# Altium project AVault.PrjPcb (part 2 of 2)

## Sheet Lighting.SchDoc
size A; SheetNumber: 5; SheetTotal: 5
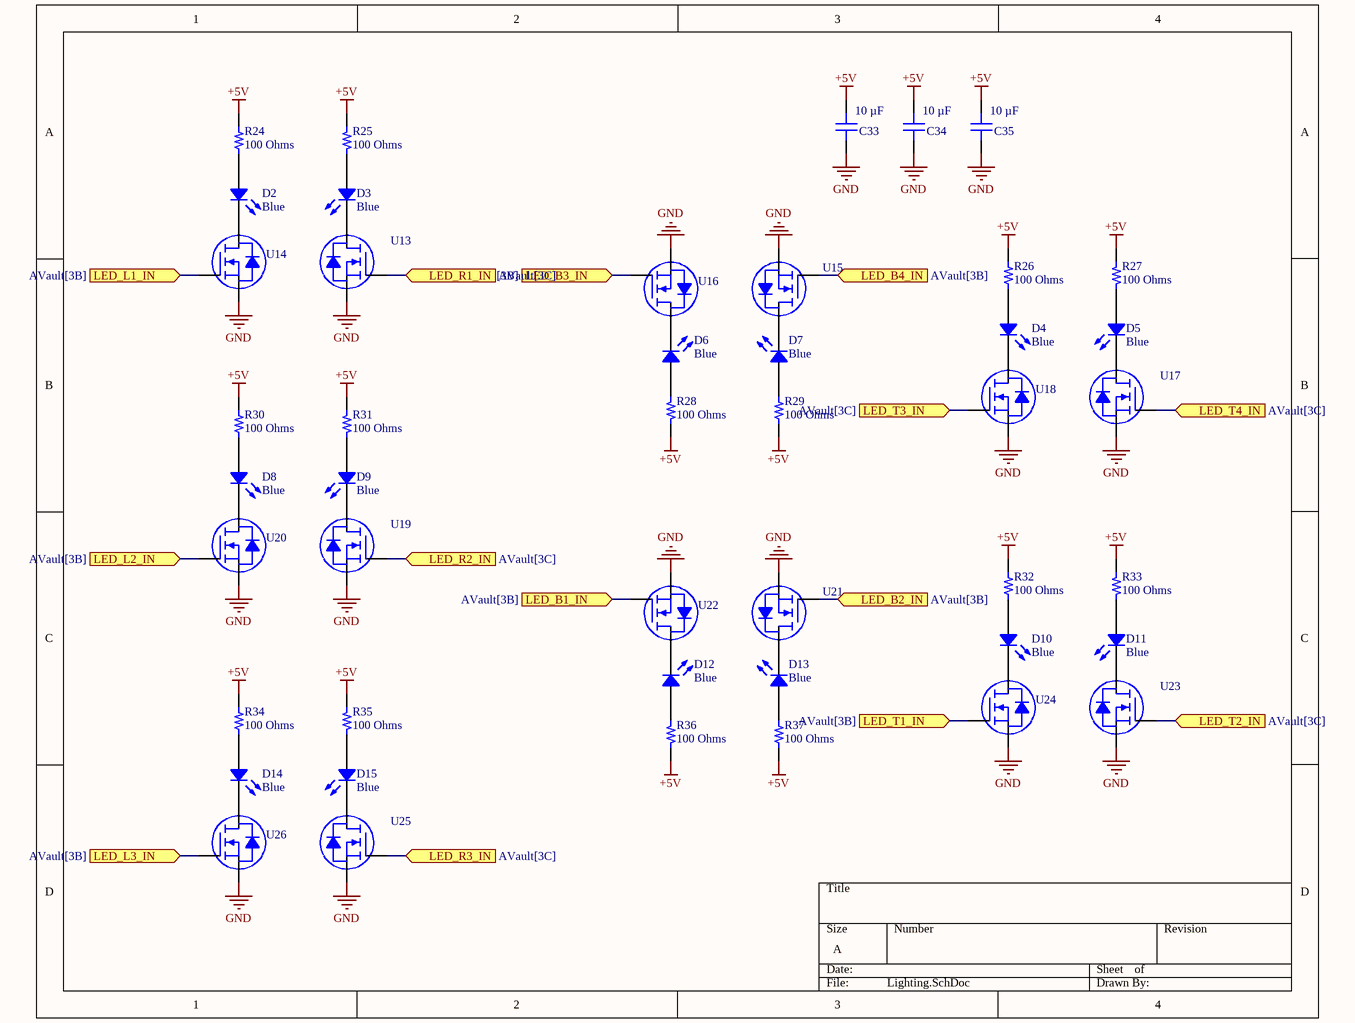
[diagram p4: Lighting.SchDoc]

### Parts
C33  10 µF  [CAP 0805_2012]
C34  10 µF  [CAP 0805_2012]
C35  10 µF  [CAP 0805_2012]
D2  Blue  [LED 0805_2012 BLUE]
D3  Blue  [LED 0805_2012 BLUE]
D4  Blue  [LED 0805_2012 BLUE]
D5  Blue  [LED 0805_2012 BLUE]
D6  Blue  [LED 0805_2012 BLUE]
D7  Blue  [LED 0805_2012 BLUE]
D8  Blue  [LED 0805_2012 BLUE]
D9  Blue  [LED 0805_2012 BLUE]
D10  Blue  [LED 0805_2012 BLUE]
D11  Blue  [LED 0805_2012 BLUE]
D12  Blue  [LED 0805_2012 BLUE]
D13  Blue  [LED 0805_2012 BLUE]
D14  Blue  [LED 0805_2012 BLUE]
D15  Blue  [LED 0805_2012 BLUE]
R24  100 Ohms  [RES 0805_2012]
R25  100 Ohms  [RES 0805_2012]
R26  100 Ohms  [RES 0805_2012]
R27  100 Ohms  [RES 0805_2012]
R28  100 Ohms  [RES 0805_2012]
R29  100 Ohms  [RES 0805_2012]
R30  100 Ohms  [RES 0805_2012]
R31  100 Ohms  [RES 0805_2012]
R32  100 Ohms  [RES 0805_2012]
R33  100 Ohms  [RES 0805_2012]
R34  100 Ohms  [RES 0805_2012]
R35  100 Ohms  [RES 0805_2012]
R36  100 Ohms  [RES 0805_2012]
R37  100 Ohms  [RES 0805_2012]
U13  2N7002A-7  [DIODES SOT-23-3]  (value not drawn)
U14  2N7002A-7  [DIODES SOT-23-3]  (value not drawn)
U15  2N7002A-7  [DIODES SOT-23-3]  (value not drawn)
U16  2N7002A-7  [DIODES SOT-23-3]  (value not drawn)
U17  2N7002A-7  [DIODES SOT-23-3]  (value not drawn)
U18  2N7002A-7  [DIODES SOT-23-3]  (value not drawn)
U19  2N7002A-7  [DIODES SOT-23-3]  (value not drawn)
U20  2N7002A-7  [DIODES SOT-23-3]  (value not drawn)
U21  2N7002A-7  [DIODES SOT-23-3]  (value not drawn)
U22  2N7002A-7  [DIODES SOT-23-3]  (value not drawn)
U23  2N7002A-7  [DIODES SOT-23-3]  (value not drawn)
U24  2N7002A-7  [DIODES SOT-23-3]  (value not drawn)
U25  2N7002A-7  [DIODES SOT-23-3]  (value not drawn)
U26  2N7002A-7  [DIODES SOT-23-3]  (value not drawn)

### Ports
LED_B1_IN (in, see AVault[3B]), LED_B2_IN (in, see AVault[3B]), LED_B3_IN (in, see AVault[3B]), LED_B4_IN (in, see AVault[3B]), LED_L1_IN (in, see AVault[3B]), LED_L2_IN (in, see AVault[3B]), LED_L3_IN (in, see AVault[3B]), LED_R1_IN (in, see AVault[3C]), LED_R2_IN (in, see AVault[3C]), LED_R3_IN (in, see AVault[3C]), LED_T1_IN (in, see AVault[3B]), LED_T2_IN (in, see AVault[3C]), LED_T3_IN (in, see AVault[3C]), LED_T4_IN (in, see AVault[3C])

### Nets
+5V: C33.2 C34.2 C35.2 R24.2 R25.2 R26.2 R27.2 R28.2 R29.2 R30.2 R31.2 R32.2 R33.2 R34.2 R35.2 R36.2 R37.2
GND: C33.1 C34.1 C35.1 U13.2(S) U14.2(S) U15.2(S) U16.2(S) U17.2(S) U18.2(S) U19.2(S) U20.2(S) U21.2(S) U22.2(S) U23.2(S) U24.2(S) U25.2(S) U26.2(S)
NetD2_1: D2.1 R24.1
NetD2_2: D2.2 U14.3(D)
NetD3_1: D3.1 R25.1
NetD3_2: D3.2 U13.3(D)
NetD4_1: D4.1 R26.1
NetD4_2: D4.2 U18.3(D)
NetD5_1: D5.1 R27.1
NetD5_2: D5.2 U17.3(D)
NetD6_1: D6.1 R28.1
NetD6_2: D6.2 U16.3(D)
NetD7_1: D7.1 R29.1
NetD7_2: D7.2 U15.3(D)
NetD8_1: D8.1 R30.1
NetD8_2: D8.2 U20.3(D)
NetD9_1: D9.1 R31.1
NetD9_2: D9.2 U19.3(D)
NetD10_1: D10.1 R32.1
NetD10_2: D10.2 U24.3(D)
NetD11_1: D11.1 R33.1
NetD11_2: D11.2 U23.3(D)
NetD12_1: D12.1 R36.1
NetD12_2: D12.2 U22.3(D)
NetD13_1: D13.1 R37.1
NetD13_2: D13.2 U21.3(D)
NetD14_1: D14.1 R34.1
NetD14_2: D14.2 U26.3(D)
NetD15_1: D15.1 R35.1
NetD15_2: D15.2 U25.3(D)
NetU4_1: U24.1(G) ; port LED_T1_IN
NetU4_15: U14.1(G) ; port LED_L1_IN
NetU4_16: U20.1(G) ; port LED_L2_IN
NetU4_17: U26.1(G) ; port LED_L3_IN
NetU4_24: U22.1(G) ; port LED_B1_IN
NetU4_30: U21.1(G) ; port LED_B2_IN
NetU4_33: U16.1(G) ; port LED_B3_IN
NetU4_53: U15.1(G) ; port LED_B4_IN
NetU4_69: U13.1(G) ; port LED_R1_IN
NetU4_70: U19.1(G) ; port LED_R2_IN
NetU4_71: U25.1(G) ; port LED_R3_IN
NetU4_77: U17.1(G) ; port LED_T4_IN
NetU4_78: U18.1(G) ; port LED_T3_IN
NetU4_98: U23.1(G) ; port LED_T2_IN

### Library data of the parts
C33-C35 = C2012X5R1V106K125AC: CAP CER 10UF 35V X5R 0805; Manufacturer: TDK Corporation; id: 6404; Tolerance: ±10%; Value: 10 µF; Temperature Coefficient: X5R; Part Number: C2012X5R1V106K125AC; Supplier Part Number 1: 445-14418-1-ND; ComponentLink2Description: DigiKey Link; Features: Low ESL; ComponentLink1URL: https:\\product.tdk.com\info\en\catalog\datasheets\mlcc_commercial_general_en.pdf?ref_disty=digikey; PartId: 40531; Supplier 1: DigiKey; Series: C; LastUpdated: 2023-01-03T20:10:34.680; Part Status: Active; Capacitance: 10 µF; Device Package: 0805 (2012 Metric); Thickness (Max): 0.057" (1.45mm); Voltage - Rated: 35V; Minimum Order: 1; Packaging: TapeAndReel; Applications: General Purpose; Package / Case: 0805 (2012 Metric); ComponentLink1Description: Datasheet; Price: 0.14; ComponentLink2URL: https:\\www.digikey.com\en\products\detail\tdk-corporation\C2012X5R1V106K125AC\3951654; Lifecycle Status: Active; Operating Temperature: -55°C ~ 85°C; Size / Dimension: 0.079" L x 0.049" W (2.00mm x 1.25mm); Mounting Type: Surface Mount, MLCC
D2-D15 = 5975606507F: LED BLUE 0805 SMD; Manufacturer: Dialight; id: 753; Lens Color: 0.93mm; Lens Style: Rectangle with Flat Top; Lens Size: 1.40mm x 1.24mm; Configuration: Standard; Wavelength - Dominant: 470nm; Voltage - Forward (Vf) (Typ): 2.9V; Current - Test: 5mA; Millicandela Rating: 36mcd; Part Number: 5975606507F; Supplier Part Number 1: 350-4390-1-ND; Supplier Device Package: 0805; ComponentLink1Description: Datasheet; Color: Blue; ComponentLink2URL: https:\\www.digikey.com\en\products\detail\dialight\5975606507F\9385445; ComponentLink1URL: http:\\www.dialightsignalsandcomponents.com\Assets\Drawings\2D_Drawings_DrawingDetailedSpec\NewDrawings\18370A.pdf; Supplier 1: DigiKey; Series: 597; Height (Max): 0.93mm; Part Status: Active; ComponentLink2Description: DigiKey Link; Device Package: 0805 (2012 Metric); Packaging: TapeAndReel; Minimum Order: 1; Package / Case: 0805 (2012 Metric); PartId: 753; Lifecycle Status: Active; LastUpdated: 2023-01-02T20:56:19; Value: Blue; Size / Dimension: 2.00mm L x 1.25mm W; Mounting Type: Surface Mount; Price: 0.14
R24-R37 = RNCS0805BKE100R: RES 100 OHM 0.1% 1\10W 0805; Manufacturer: Stackpole Electronics Inc; id: 1341; Temperature Coefficient: ±25ppm\°C; Power (Watts): 0.1W, 1\10W; Part Number: RNCS0805BKE100R; Height - Seated (Max): 0.026" (0.65mm); Supplier Part Number 1: RNCS0805BKE100RCT-ND; Supplier Device Package: 0805; ComponentLink1Description: Datasheet; ComponentLink2URL: https:\\www.digikey.com\en\products\detail\stackpole-electronics-inc\RNCS0805BKE100R\1800065; Features: Anti-Corrosive, Automotive AEC-Q200, Moisture Resistant; ComponentLink1URL: https:\\www.seielect.com\catalog\sei-rncs_rnch.pdf; Composition: Thin Film; Tolerance: ±0.1%; Supplier 1: DigiKey; Series: RNCS; Part Status: Active; ComponentLink2Description: DigiKey Link; Device Package: 0805 (2012 Metric); Packaging: TapeAndReel; Ratings: AEC-Q200; Minimum Order: 1; Package / Case: 0805 (2012 Metric); PartId: 30410; Lifecycle Status: Active; LastUpdated: 2023-01-02T20:44:41.260; Operating Temperature: -55°C ~ 155°C; Number Of Terminations: 2; Value: 100 Ohms; Size / Dimension: 0.079" L x 0.049" W (2.00mm x 1.25mm); Price: 0.09; Resistance: 100 Ohms
U13-U26 = 2N7002A-7: MOSFET N-CH 60V 180MA SOT23; Manufacturer: Diodes Incorporated; id: 68; FET Type: N-Channel; Drive Voltage (Max Rds On,  Min Rds On): 5V, 10V; Power Dissipation (Max): 370mW (Ta); Vgs (Max): ±20V; Input Capacitance (Ciss) (Max) @ Vds: 23 pF @ 25 V; Current - Continuous Drain (Id) @ 25°C: 180mA (Ta); Rds On (Max) @ Id, Vgs: 6Ohm @ 115mA, 5V; Vgs(Th) (Max) @ Id: 2V @ 250µA; Part Number: 2N7002A-7; Supplier Part Number 1: 2N7002A-7DICT-ND; Supplier Device Package: SOT-23-3; ComponentLink1Description: Datasheet; ComponentLink2URL: https:\\www.digikey.com\en\products\detail\diodes-incorporated\2N7002A-7\3451498; ComponentLink1URL: https:\\www.diodes.com\assets\Datasheets\ds31360.pdf; Supplier 1: DigiKey; Series: -; Part Status: Active; ComponentLink2Description: DigiKey Link; Packaging: TapeAndReel; Minimum Order: 1; Drain To Source Voltage (Vdss): 60 V; Package / Case: TO-236-3, SC-59, SOT-23-3; Lifecycle Status: Active; LastUpdated: 2023-01-02T21:04:51.983; Technology: MOSFET (Metal Oxide); Operating Temperature: -55°C ~ 150°C (TJ); Mounting Type: Surface Mount; Price: 0.05

## Nets that join several sheets
+3V3: Power (C6.2 R4.2 U2.9 U2.10), MCU (18 pins), IO_Devices (13 pins)
+5V: Power (10 pins), IO_Devices (9 pins), Lighting (17 pins)
GND: Power (30 pins), MCU (18 pins), IO_Devices (33 pins), Lighting (17 pins)
NetC20_2: MCU (U4.25), IO_Devices (C20.2 R10.1 U5.1 U5.2)
NetC21_2: MCU (U4.26), IO_Devices (C21.2 R11.1 U6.1 U6.2)
NetC22_2: MCU (U4.29), IO_Devices (C22.2 R12.1 U7.1 U7.2)
NetC23_2: MCU (U4.32), IO_Devices (C23.2 R13.1 U8.1 U8.2)
NetC24_2: MCU (U4.31), IO_Devices (C24.2 R16.1 U9.1 U9.2)
NetJ3_3: MCU (U4.95), IO_Devices (J3.3 R15.1)
NetJ3_4: MCU (U4.96), IO_Devices (J3.4 R14.1)
NetR17_2: MCU (U4.52), IO_Devices (R17.2)
NetR18_1: MCU (U4.51), IO_Devices (R18.1)
NetR19_1: MCU (U4.35), IO_Devices (R19.1 U11.3)
NetR20_1: MCU (U4.47), IO_Devices (R20.1 U12.23)
NetR21_1: MCU (U4.48), IO_Devices (R21.1 U12.24)
NetR22_2: MCU (U4.36), IO_Devices (R22.2 R23.2)
NetU4_1: MCU (U4.1), Lighting (U24.1)
NetU4_15: MCU (U4.15), Lighting (U14.1)
NetU4_16: MCU (U4.16), Lighting (U20.1)
NetU4_17: MCU (U4.17), Lighting (U26.1)
NetU4_24: MCU (U4.24), Lighting (U22.1)
NetU4_30: MCU (U4.30), Lighting (U21.1)
NetU4_33: MCU (U4.33), Lighting (U16.1)
NetU4_46: MCU (U4.46), IO_Devices (U12.12)
NetU4_53: MCU (U4.53), Lighting (U15.1)
NetU4_69: MCU (U4.69), Lighting (U13.1)
NetU4_70: MCU (U4.70), Lighting (U19.1)
NetU4_71: MCU (U4.71), Lighting (U25.1)
NetU4_77: MCU (U4.77), Lighting (U17.1)
NetU4_78: MCU (U4.78), Lighting (U18.1)
NetU4_98: MCU (U4.98), Lighting (U23.1)